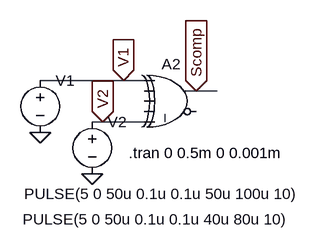
[diagram p0: schematic Comparateur.asc]
Comparateur.asc, the LTspice schematic file:
Version 4.1
SHEET 1 1492 680
WIRE 176 48 48 48
WIRE 208 48 176 48
WIRE 288 64 272 64
WIRE 320 64 288 64
WIRE 144 112 128 112
WIRE 208 112 144 112
FLAG 176 48 V1
IOPIN 176 48 In
FLAG 288 64 Scomp
IOPIN 288 64 In
FLAG 48 128 0
FLAG 128 192 0
FLAG 144 112 V2
IOPIN 144 112 In
SYMBOL Digital\\xor 256 16 R0
WINDOW 0 -21 7 Left 2
SYMATTR InstName A2
SYMBOL voltage 48 32 R0
WINDOW 3 -25 191 Left 2
WINDOW 123 0 0 Left 0
WINDOW 39 0 0 Left 0
SYMATTR Value PULSE(5 0 50u 0.1u 0.1u 50u 100u 10)
SYMATTR InstName V1
SYMBOL voltage 128 96 R0
WINDOW 3 -107 166 Left 2
WINDOW 123 0 0 Left 0
WINDOW 39 0 0 Left 0
SYMATTR Value PULSE(5 0 50u 0.1u 0.1u 40u 80u 10)
SYMATTR InstName V2
TEXT 184 160 Left 2 !.tran 0 0.5m 0 0.001m

The netlist it stands for:
* Comparateur.asc
A2 V1 0 0 0 V2 0 Scomp 0 XOR
V1 V1 0 PULSE(5 0 50u 0.1u 0.1u 50u 100u 10)
V2 V2 0 PULSE(5 0 50u 0.1u 0.1u 40u 80u 10)
.tran 0 0.5m 0 0.001m
.backanno
.end